# Altium schematic sheet Sheet3.SchDoc
size A4; SheetNumber: 3; SheetTotal: 3
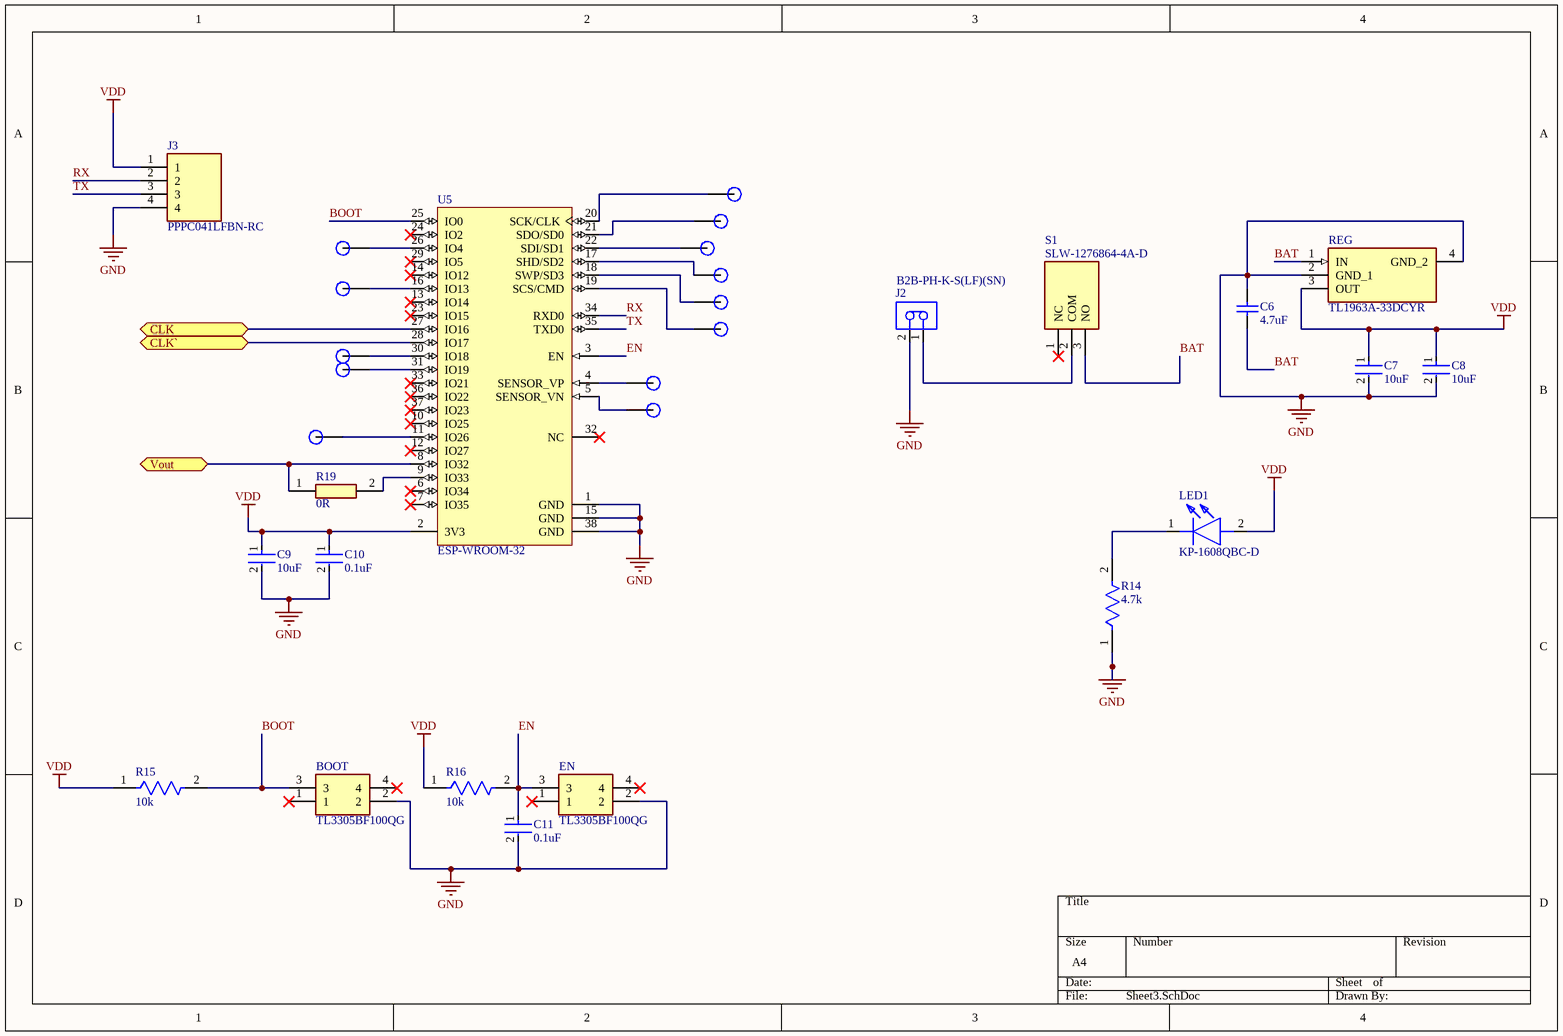
[diagram p0: Sheet3.SchDoc]

## Parts
BOOT  TL3305BF100QG  [TL3305BF160QG]
C6  4.7uF  [CAPC2013X145X50NL20T25]
C7  10uF  [FP-C0805C106K4PACTU-MFG]
C8  10uF  [FP-C0805C106K4PACTU-MFG]
C9  10uF  [FP-C0805C106K4PACTU-MFG]
C10  0.1uF  [FP-C0805C-DN-MFG]
C11  0.1uF  [FP-C0805C-DN-MFG]
EN  TL3305BF100QG  [TL3305BF160QG]
J2  B2B-PH-K-S(LF)(SN)  [JST-B2B-PH-K-S_V]
J3  PPPC041LFBN-RC  [RHDR4W80P0X254_1X4_1066X254X850P]
LED1  KP-1608QBC-D  [KP1608QBCD]
R14  4.7k  [FP-RMCF0805-MFG]
R15  10k  [FP-CRGP0805-IPC_C]
R16  10k  [FP-CRGP0805-IPC_C]
R19  0R  [RESC1608X55N]
REG  TL1963A-33DCYR  [SOT230P700X180-4N]
S1  SLW-1276864-4A-D  [SLW12768644AD]
TP12  Test_Point  [Test_Point-Footprint-1]  (value not drawn)
TP13  Test_Point  [Test_Point-Footprint-1]  (value not drawn)
TP14  Test_Point  [Test_Point-Footprint-1]  (value not drawn)
TP15  Test_Point  [Test_Point-Footprint-1]  (value not drawn)
TP16  Test_Point  [Test_Point-Footprint-1]  (value not drawn)
TP17  Test_Point  [Test_Point-Footprint-1]  (value not drawn)
TP18  Test_Point  [Test_Point-Footprint-1]  (value not drawn)
TP19  Test_Point  [Test_Point-Footprint-1]  (value not drawn)
TP20  Test_Point  [Test_Point-Footprint-1]  (value not drawn)
TP21  Test_Point  [Test_Point-Footprint-1]  (value not drawn)
TP22  Test_Point  [Test_Point-Footprint-1]  (value not drawn)
TP23  Test_Point  [Test_Point-Footprint-1]  (value not drawn)
TP24  Test_Point  [Test_Point-Footprint-1]  (value not drawn)
U5  ESP-WROOM-32  [OLMX-ESP-WROOM-32]

## Ports
CLK (bidir), CLK` (bidir), Vout (bidir)

## Nets
GND: BOOT.2 C6.1 C7.2 C8.2 C9.2 C10.2 C11.2 EN.2 J2.2 J3.4 R14.1 REG.2(GND_1) REG.4(GND_2) U5.1(GND) U5.15(GND) U5.38(GND)
VDD: C7.1 C8.1 C9.1 C10.1 J3.1 LED1.2(A) R15.1 R16.1 REG.3(OUT) U5.2(3V3)
BAT: C6.2 REG.1(IN) S1.3(NO)
BOOT: BOOT.3 R15.2 U5.25(IO0)
CLK: U5.27(IO16) ; port CLK
CLK`: U5.28(IO17) ; port CLK`
EN: C11.1 EN.3 R16.2 U5.3(EN)
RX: J3.2 U5.34(RXD0)
TX: J3.3 U5.35(TXD0)
Vout: R19.1 U5.8(IO32) ; port Vout
NetJ2_1: J2.1 S1.2(COM)
NetLED1_1: LED1.1(K) R14.2
NetR19_2: R19.2 U5.9(IO33)
NetTP12_1: TP12.1 U5.20(SCK/CLK)
NetTP13_1: TP13.1 U5.21(SDO/SD0)
NetTP14_1: TP14.1 U5.26(IO4)
NetTP15_1: TP15.1 U5.22(SDI/SD1)
NetTP16_1: TP16.1 U5.17(SHD/SD2)
NetTP17_1: TP17.1 U5.16(IO13)
NetTP18_1: TP18.1 U5.18(SWP/SD3)
NetTP19_1: TP19.1 U5.19(SCS/CMD)
NetTP20_1: TP20.1 U5.30(IO18)
NetTP21_1: TP21.1 U5.31(IO19)
NetTP22_1: TP22.1 U5.4(SENSOR_VP)
NetTP23_1: TP23.1 U5.5(SENSOR_VN)
NetTP24_1: TP24.1 U5.11(IO26)

Not connected (* = marked no-connect by the designer): BOOT 1* 4*; EN 1* 4*; S1 1(NC)*; U5 6(IO34)* 7(IO35)* 10(IO25)* 12(IO27)* 13(IO14)* 14(IO12)* 23(IO15)* 24(IO2)* 29(IO5)* 32(NC)* 33(IO21)* 36(IO22)* 37(IO23)*

## Library data of the parts
BOOT EN = TL3305BF100QG: Switch; Manufacturer_Name: E-Switch; Datasheet Link: https://configured-product-images.s3.amazonaws.com/2D/specs/TL3305BF100QG.pdf; Manufacturer_Part_Number: TL3305BF100QG; Mouser Part Number: 612-TL3305BF100QG; Mouser Price/Stock: https://www.mouser.co.uk/ProductDetail/E-Switch/TL3305BF100QG?qs=IKkN%2F947nfDIPwqPQja%252BvQ%3D%3D
C6 = CMP-2007-01149-1: Part Number: C0805C475M8RACTU; Manufacturer: Kemet
C7-C9 = CMP-03020-034671-1: CAP CER 10UF 16V X5R 0805; Dissipation Factor: 5%; Tolerance: 10%; Dielectric Material: Ceramic; REACH SVHC: No SVHC; Packaging: Tape and Reel; Series: C; Min Operating Temperature: -55°C; Construction: Flat; Radiation Hardening: No; Case Code (Metric): 2012; Contact Plating: Tin; Case Code (Imperial): 0805; Voltage Rating: 16V; Mount: Surface Mount; Width: 0.049inch; Voltage: 16V; Dielectric: X5R; Height: 1.25mm; Depth: 1.25mm; Case/Package: 0805; Max Operating Temperature: 85°C; Length: 2mm; Thickness: 0.055inch; Termination: SMD/SMT; Capacitance: 10uF; Number of Pins: 2; Voltage Rating (DC): 16V; Lead Free: Lead Free; Package Quantity: 1
C10 C11 = CMP-2007-00274-2: CAP CER 0.1UF 16V X7R 0805; Manufacturer Part Number: C0805C104K4RACTU; Manufacturer: KEMET; Material: Ceramic; Tolerance: 0.1; Capacitance: 0.10 μF; Value: 0.10 μF; Temperature Coefficient: 30ppm/°C; Device Class L3: Ceramic Capacitors; RoHS: TRUE; Octopart: https://octopart.com/c0805c104k4ractu-kemet-92155; ComponentLink2Description: Datasheet; ComponentLink2URL: https://content.kemet.com/datasheets/KEM_C1003_C0G_SMD.pdf; Temperature Range High: +125°C; Category: Cap; Lead Free: Yes; Digikey Description: CAP CER 0.1UF 16V X7R 0805; Automotive: No; Temperature Range Low: -55°C; Voltage Rating: 16 V; Package: C0805C-DN; Ipc Land Pattern Name: CAPC200125X78; Height: 0.88mm; Device Class L1: Passive Components; Temperature: -55°C to +125°C; Mouser Description: Multilayer Ceramic Capacitors MLCC - SMD/SMT 16volts 0.1uF X7R 10%; Device Class L2: Capacitors; Temperature Characteristic: X7R
J2 = CMP-2000-05162-1: Male Header, Pitch 2 mm, 1 x 2 Position, Height 6 mm, Tail Length 3.4 mm, -25 to 85 degC, RoHS, Bulk; Manufacturer: JST; Pitch: 2mm; Style/Orientation: StraightHeader/Plug; No of Positions: 2; Datasheet Version: Nov-08; Datasheet URL: http://datasheet.octopart.com/B2B-PH-K-S%28LF%29%28SN%29-JST-datasheet-8324864.pdf; Manufacturer URL: http://www.jst.com/home2.html; Type: ShroudedHeader; Termination: Crimp
J3 = PPPC041LFBN-RC: Connector; Manufacturer_Name: Sullins; Datasheet Link: https://drawings-pdf.s3.amazonaws.com/10492.pdf; Height: 8.5mm; Manufacturer_Part_Number: PPPC041LFBN-RC
LED1 = KP-1608QBC-D: LED; Manufacturer_Name: Kingbright; Datasheet Link: https://www.kingbright.com/attachments/file/psearch/000/00/00/KP-1608QBC-D(Ver.24B).pdf; Height: 1.1mm; Manufacturer_Part_Number: KP-1608QBC-D; Mouser Part Number: N/A; Mouser Price/Stock: https://www.mouser.co.uk/ProductDetail/Kingbright/KP-1608QBC-D?qs=2JU0tDl2GZ0HuHAuzYJmHg%3D%3D; Arrow Part Number: KP-1608QBC-D; Arrow Price/Stock: https://www.arrow.com/en/products/kp-1608qbc-d/kingbright?region=europe
R14 = CMP-26527-004085-1: 4.7kΩ ±5% 0.125W 0805 Thick Film Chip Resistor AEC-Q200 compliant; Temperature Coefficient: 200ppm/°C; Max Power Dissipation: 125mW; Resistance: 4.7kR; RoHS Compliant: Yes; Package Quantity: 10000; Packaging: Tape and Reel; Contact Plating: Tin; Radiation Hardening: No; Mount: Surface Mount; Height: 0.026inch; Case Code (Metric): 2012; Tolerance: 5%; Case/Package: 0805; Width: 0.049inch; Series: RMCF; Case Code (Imperial): 0805; Number of Terminations: 2; Min Operating Temperature: -55°C; Resistor Type: Thick Film; Max Operating Temperature: 155°C; Length: 0.079inch; Features: Automotive AEC-Q200
R15 R16 = CMP-03211-006861-1: CRGP 0805 10K 1%; Manufacturer Part Number: CRGP0805F10K; Manufacturer: TE; Power Rating: 0.33W; Voltage Rating: 150V; Value: 10KΩ; Tolerance: 0.01; Temperature Coefficient: ±100ppm/°C; ComponentLink2URL: https://www.mouser.com/datasheet/2/418/NG_DS_9-1773463-9_A-1358566.pdf; Temperature Range Low: -55°C; Ipc Land Pattern Name: RESC200125X55; Device Class L2: Resistors; Automotive: No; Device Class L3: Chip SMD Resistors; Composition: Thick Film; Temperature Range High: +155°C; Temperature: -55°C to +155°C; Height: 0.65mm; Series: CRGP; RoHS: TRUE; Device Class L1: Passive Components; Octopart: https://octopart.com/crgp0805f10k-te+connectivity-91018782; Package: CRGP0805; Digikey Description: CRGP 0805 10K 1%; Ambient Temperature Range High: +70°C; Lead Free: Yes; ComponentLink2Description: Datasheet; Category: Res; Resistance: 10KΩ
R19 = RC0603JR-070RL: Resistor; Manufacturer_Name: Yageo Group; Datasheet Link: http://www.yageo.com/documents/recent/PYu-RC0603_51_RoHS_L_v5.pdf; Height: 0.55mm; Manufacturer_Part_Number: RC0603JR-070RL; Mouser Part Number: 603-RC0603JR-070RL; Mouser Price/Stock: https://www.mouser.co.uk/ProductDetail/YAGEO/RC0603JR-070RL?qs=2cAdsCoAWRGWyPcuXgGiXQ%3D%3D; Arrow Part Number: RC0603JR-070RL; Arrow Price/Stock: https://www.arrow.com/en/products/rc0603jr-070rl/yageo?utm_currency=USD&region=nac
REG = TL1963A-33DCYR: Power Supply; Manufacturer_Name: Texas Instruments; Datasheet Link: http://www.ti.com/lit/gpn/tl1963a; Height: 1.8mm; Manufacturer_Part_Number: TL1963A-33DCYR; Mouser Part Number: 595-TL1963A-33DCYR; Mouser Price/Stock: https://www.mouser.co.uk/ProductDetail/Texas-Instruments/TL1963A-33DCYR?qs=IK5e5L0zOXhRu%2FNTAfJNEA%3D%3D; Arrow Part Number: TL1963A-33DCYR; Arrow Price/Stock: https://www.arrow.com/en/products/tl1963a-33dcyr/texas-instruments?utm_currency=USD&region=nac
S1 = SLW-1276864-4A-D: Switch; Manufacturer_Name: Same Sky; Datasheet Link: https://www.sameskydevices.com/product/resource/supplyframepdf/slw-1276864-4a-d.pdf; Height: 10.6mm; Manufacturer_Part_Number: SLW-1276864-4A-D; Mouser Part Number: 179-SLW-1276864-4A-D; Mouser Price/Stock: https://www.mouser.co.uk/ProductDetail/Same-Sky/SLW-1276864-4A-D?qs=1Kr7Jg1SGW90vOt02EYiag%3D%3D; Arrow Part Number: SLW-1276864-4A-D; Arrow Price/Stock: https://www.arrow.com/en/products/slw-1276864-4a-d/cui-devices?utm_currency=USD&region=nac
TP12-TP24 = CMP-00030-00001-2
U5 = CMP-2000-07454-1: Espressif System, 2.7 to 3.6 V, -40 to 85 degC, 38-Pin SMD; Manufacturer: Olimex; Package Description: 38-Pin Surface Mount Device, Body 18 x 25.5 mm, Pitch 1.27 mm; Manufacturer URL: https://www.olimex.com; RoHSCompliant: false; Mounting Technology: SurfaceMount; Datasheet Version: Rev. 2.1, 09/2017; Datasheet URL: http://www.espressif.com/sites/default/files/documentation/esp-wroom-32_datasheet_en.pdf; Package Reference: ESP-WROOM-32